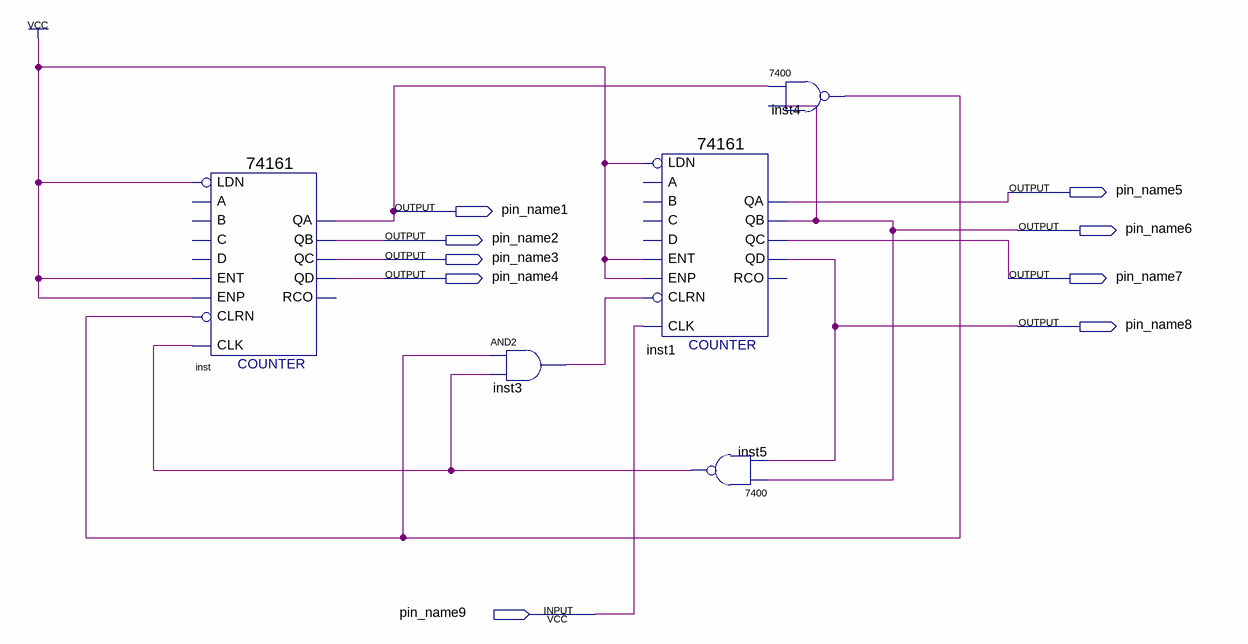
[diagram p0: schematic sheet]
// Quartus schematic exp4-2.bdf as structural Verilog: 5 symbols, 9 pins
module \exp4-2  (
  input  pin_name9,
  output pin_name5,
  output pin_name1,
  output pin_name6,
  output pin_name2,
  output pin_name3,
  output pin_name4,
  output pin_name7,
  output pin_name8
);

  wire inst3_out, inst4_1, inst5_1;

  \74161  inst (
    .CLRN(inst4_1), .CLK(inst5_1), .ENP(1'b1), .LDN(1'b1), .ENT(1'b1), .QD(pin_name4), .QC(pin_name3),
    .QB(pin_name2), .QA(pin_name1));  // open: A, D, B, C, RCO
  and inst3 (inst3_out, inst4_1, inst5_1);
  \74161  inst1 (
    .CLRN(inst3_out), .CLK(pin_name9), .ENP(1'b1), .LDN(1'b1), .ENT(1'b1), .QD(pin_name8), .QC(pin_name7),
    .QB(pin_name6), .QA(pin_name5));  // open: A, D, B, C, RCO
  \7400  inst5 (.\3 (pin_name8), .\2 (pin_name6), .\1 (inst5_1));
  \7400  inst4 (.\3 (pin_name6), .\2 (pin_name1), .\1 (inst4_1));
endmodule
